# Altium schematic sheet Sheet2.SchDoc
size A; SheetNumber: 2; SheetTotal: 10
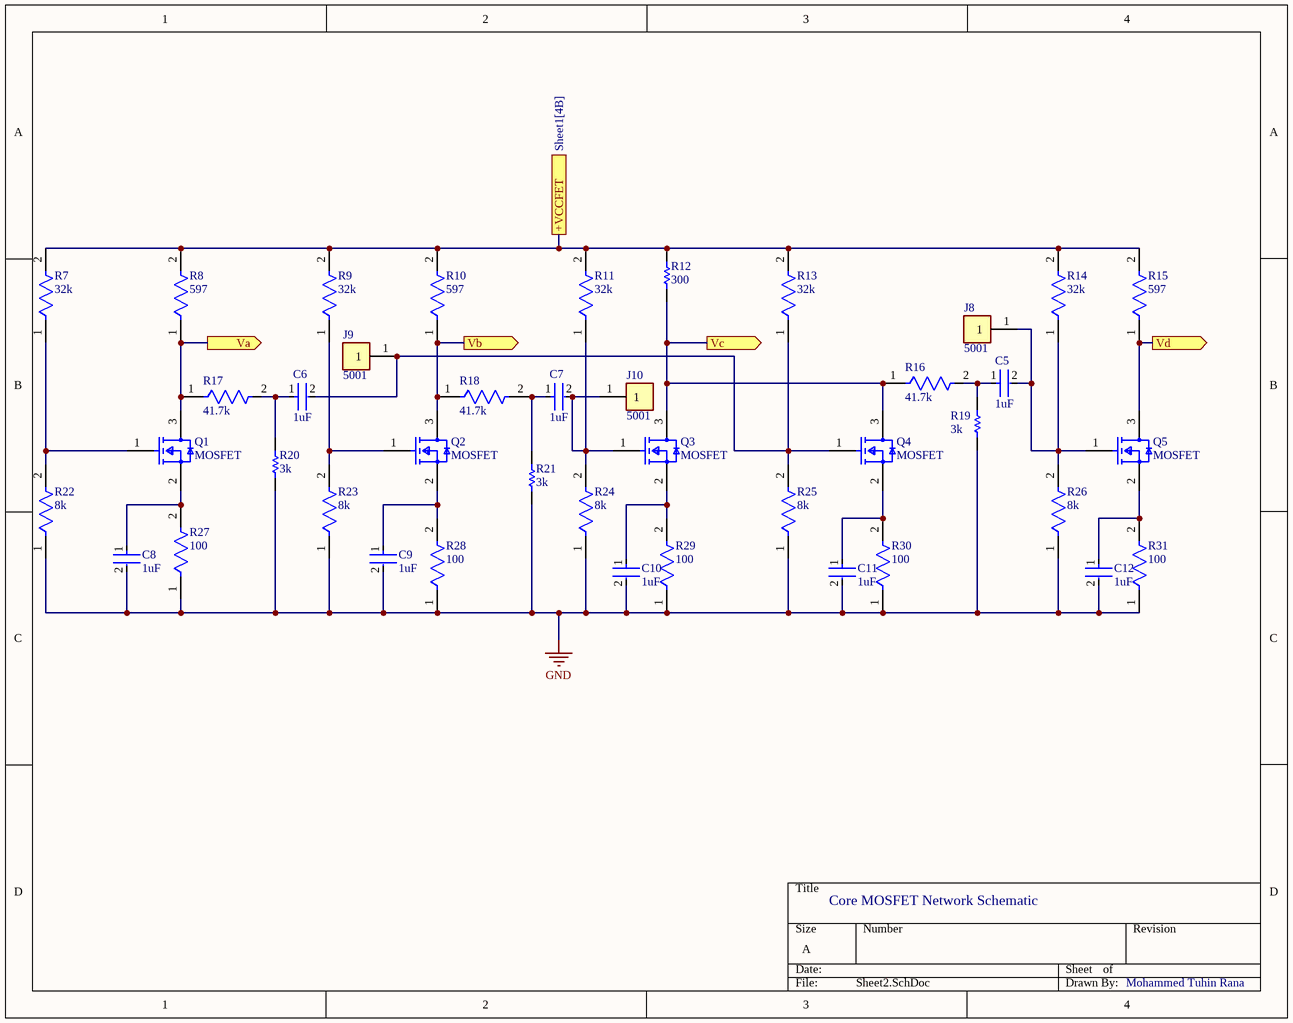
[diagram p0: Sheet2.SchDoc]

## Parts
C5  1uF  [FP-CL10-IPC_C]
C6  1uF  [FP-CL10-IPC_C]
C7  1uF  [FP-CL10-IPC_C]
C8  1uF  [FP-CL10-IPC_C]
C9  1uF  [FP-CL10-IPC_C]
C10  1uF  [FP-CL10-IPC_C]
C11  1uF  [FP-CL10-IPC_C]
C12  1uF  [FP-CL10-IPC_C]
J8  5001  [FP-5001-MFG]
J9  5001  [FP-5001-MFG]
J10  5001  [FP-5001-MFG]
Q1  MOSFET  [FP-318-08-IPC_B]
Q2  MOSFET  [FP-318-08-IPC_A]
Q3  MOSFET  [FP-318-08-IPC_A]
Q4  MOSFET  [FP-318-08-IPC_A]
Q5  MOSFET  [FP-318-08-IPC_A]
R7  32k  [FP-RT0603-0_55-MFG]
R8  597  [FP-RN73R2B-MFG]
R9  32k  [FP-RT0603-0_55-MFG]
R10  597  [FP-RN73R2B-MFG]
R11  32k  [FP-RT0603-0_55-MFG]
R12  300  [RESC3225X70X50ML20T20]
R13  32k  [FP-RT0603-0_55-MFG]
R14  32k  [FP-RT0603-0_55-MFG]
R15  597  [FP-RN73R2B-MFG]
R16  41.7k  [FP-RN73R1J-MFG]
R17  41.7k  [FP-RN73R1J-MFG]
R18  41.7k  [FP-RN73R1J-MFG]
R19  3k  [RESC1608X55X25ML10T15]
R20  3k  [RESC1608X55X25ML10T15]
R21  3k  [RESC1608X55X25ML10T15]
R22  8k  [FP-RT0603-0_55-MFG]
R23  8k  [FP-RT0603-0_55-MFG]
R24  8k  [FP-RT0603-0_55-MFG]
R25  8k  [FP-RT0603-0_55-MFG]
R26  8k  [FP-RT0603-0_55-MFG]
R27  100  [FP-ERA3A-IPC_B]
R28  100  [FP-ERA3A-IPC_B]
R29  100  [FP-ERA3A-IPC_B]
R30  100  [FP-ERA3A-IPC_B]
R31  100  [FP-ERA3A-IPC_B]

## Ports
+VCCFET (see Sheet1[4B]), Va (out, see Sheet3[1A]), Vb (out, see Sheet4[1A]), Vc (out, see Sheet6[1A]), Vd (out, see Sheet5[1A])

## Nets
GND: C8.2 C9.2 C10.2 C11.2 C12.2 R19.1 R20.1 R21.1 R22.1 R23.1 R24.1 R25.1 R26.1 R27.1 R28.1 R29.1 R30.1 R31.1
+VCCFET: R7.2 R8.2 R9.2 R10.2 R11.2 R12.2 R13.2 R14.2 R15.2 ; port +VCCFET
Va: Q1.3(Drain) R8.1 R17.1 ; port Va
Vb: Q2.3(Drain) R10.1 R18.1 ; port Vb
Vc: Q3.3(Drain) Q4.3(Drain) R12.1 R16.1 ; port Vc
Vd: Q5.3(Drain) R15.1 ; port Vd
NetC5_1: C5.1 R16.2 R19.2
NetC5_2: C5.2 J8.1 Q5.1(Gate) R14.1 R26.2
NetC6_1: C6.1 R17.2 R20.2
NetC6_2: C6.2 J9.1 Q4.1(Gate) R13.1 R25.2
NetC7_1: C7.1 R18.2 R21.2
NetC7_2: C7.2 J10.1 Q3.1(Gate) R11.1 R24.2
NetC8_1: C8.1 Q1.2(Source) R27.2
NetC9_1: C9.1 Q2.2(Source) R28.2
NetC10_1: C10.1 Q3.2(Source) R29.2
NetC11_1: C11.1 Q4.2(Source) R30.2
NetC12_1: C12.1 Q5.2(Source) R31.2
NetQ1_1: Q1.1(Gate) R7.1 R22.2
NetQ2_1: Q2.1(Gate) R9.1 R23.2

## Notes on the sheet
- Core MOSFET Network Schematic
- Mohammed Tuhin Rana

## Library data of the parts
C5-C12 = CMP-13271-004127-1: Cap Ceramic 1uF 25V X5R ±10% Pad SMD 0603 +85°C T/R; Height: 0.8mm; Capacitance: 1uF; Depth: 0.8mm; Package Quantity: 1; Mount: Surface Mount; Contact Plating: Tin; Voltage Rating: 25V; Dielectric: X5R; Packaging: Tape and Reel; Material: Ceramic; Case Code (Metric): 1608; Length: 1.6mm; Voltage: 25V; Min Operating Temperature: -55°C; Width: 0.031inch; Tolerance: 10%; Case/Package: 0603; Radiation Hardening: No; Case Code (Imperial): 0603; Thickness: 0.035inch; Lead Free: Lead Free; Max Operating Temperature: 85°C; Voltage Rating (DC): 25V
J8-J10 = CMP-2000-05181-2: PC TEST POINT MINIATURE BLACK; Body Material: Bronze; Plating: Silver; Inside Diameter: 1.27mm; Hole Diameter: 1.6mm; Number of Ports: 1; Outside Diameter: 2.54mm; Insulation: Insulated; Insulation Material: Nylon; Mount: Through Hole; RoHS Compliant: Yes; Series: THM; Height: 0.3inch; Termination: Through Hole; Material: Nylon; Packaging: Bulk; Contact Material: Bronze; REACH SVHC: No SVHC; Contact Plating: Silver; Orientation: Straight; Lead Free: Lead Free; Package Quantity: 100; Length: 7.62mm; Flammability Rating: UL94 V-0; Number of Contacts: 1; Diameter: 2.54mm; Housing Color: Black; Color: Black
Q1-Q5 = CMP-1058-00769-2: MOSFET N-CH 60V 260MA SOT-23; On-State Resistance: 2.5R; Turn-Off Delay Time: 4.8ns; Nominal Vgs: 1V; Element Configuration: Single; Rise Time: 1.2ns; Input Capacitance: 26.7pF; Number of Elements: 1; Turn-On Delay Time: 1.7ns; Gate to Source Voltage (Vgs): 20V; Max Power Dissipation: 300mW; Drain to Source Breakdown Voltage: 60V; Max Operating Temperature: 150°C; REACH SVHC: No SVHC; Case/Package: SOT-23-3; Lead Free: Lead Free; Length: 2.9mm; Height: 0.94mm; Package Quantity: 3000; Min Operating Temperature: -55°C; Radiation Hardening: No; Packaging: Tape and Reel; Fall Time: 1.2ns; Drain to Source Resistance: 2.5R; Halogen Free: Halogen Free; Threshold Voltage: 1V; Number of Pins: 3; Continuous Drain Current (ID): 260mA; Rds On Max: 2.5R; Power Dissipation: 300mW; Width: 1.3mm
R7 R9 R11 R13 R14 = CMP-00621-34935746-1: RT0603BRD0732KL High Precision-High Stability Chip Resistor Thin Film 0603 32kOhm 0.1% Paper T/R; Resistance: 32kΩ; Temperature Coefficient: 25ppm/°C; Max Power Dissipation: 100mW; Case/Package: 0603; Composition: Thin Film; Features: Moisture Resistant; Packaging: Tape & Reel; RoHS: Compliant; Height: 558.8µm; Max Operating Temperature: 155°C; NexarPartId: 34935746; Number of Terminations: 2; Length: 1.6002mm; Width: 787.4µm; Tolerance: 0.1%; Min Operating Temperature: -55°C
R8 R10 R15 = CMP-04015-006526-1: 597Ω ±0.1% 0.25W, 1/4W Chip Resistor 1206 (3216 Metric) Moisture Resistant Thin Film
R12 = CMP-2005-03919-1: Manufacturer: Panasonic; Part Number: ERJP14F3000U
R16-R18 = CMP-04015-068438-1: 41.7kΩ ±1% 0.1W, 1/10W Chip Resistor 0603 (1608 Metric) Moisture Resistant Thin Film
R19-R21 = CMP-2000-04454-1: Part Number: RT0603BRD073KL; Manufacturer: Yageo
R22-R26 = CMP-00621-71394448-1: RT0603BRE078KL SMD Chip Resistor, 8 kOhm, ± 0.1%, 100 mW, 0603 [1608 Metric], Thin Film, High Precision High Stability; Power Rating: 100mW; Voltage Rating: 75V; Temperature Coefficient: 50ppm/°C; Resistance: 8kΩ; NexarPartId: 71394448; Number of Terminations: 2; Features: Moisture Resistant; Min Operating Temperature: -55°C; Height: 550µm; Case/Package: 0603; Max Operating Temperature: 155°C; Packaging: Tape & Reel; Tolerance: 0.1%; Length: 1.6002mm; Max Power Dissipation: 100mW; RoHS: Compliant; Composition: Thin Film; Width: 787.4µm
R27-R31 = CMP-2000-00870-2: RES SMD 100 OHM 0.1% 1/10W 0603; Voltage Rating: 75V; Power Rating: 100mW; Resistance: 100R; Temperature Coefficient: 25ppm/°C; Number of Terminations: 2; Case/Package: 0603; Termination: SMD/SMT; Number of Pins: 2; Size Code: 0603; Length: 1.6mm; Min Operating Temperature: -55°C; Resistor Type: Thin Film; Depth: 0.8mm; Military Standard: Not; Packaging: Tape and Reel; RoHS Compliant: Yes; Construction: Rectangular; Resistance Tolerance: 0.1%; Contact Plating: Tin; Width: 0.8mm; Mount: Surface Mount; Case Code (Metric): 1608; Max Operating Temperature: 155°C; Height: 0.45mm; Case Code (Imperial): 0603; Series: ERA-3A; Package Quantity: 5000; REACH SVHC: No SVHC; Tolerance: 0.1%; Max Power Dissipation: 100mW; Radiation Hardening: No; Technology: METAL FILM